# Altium schematic sheet Top_Section.SchDoc
size 420 x 297 mm; SheetNumber: 1; SheetTotal: 5
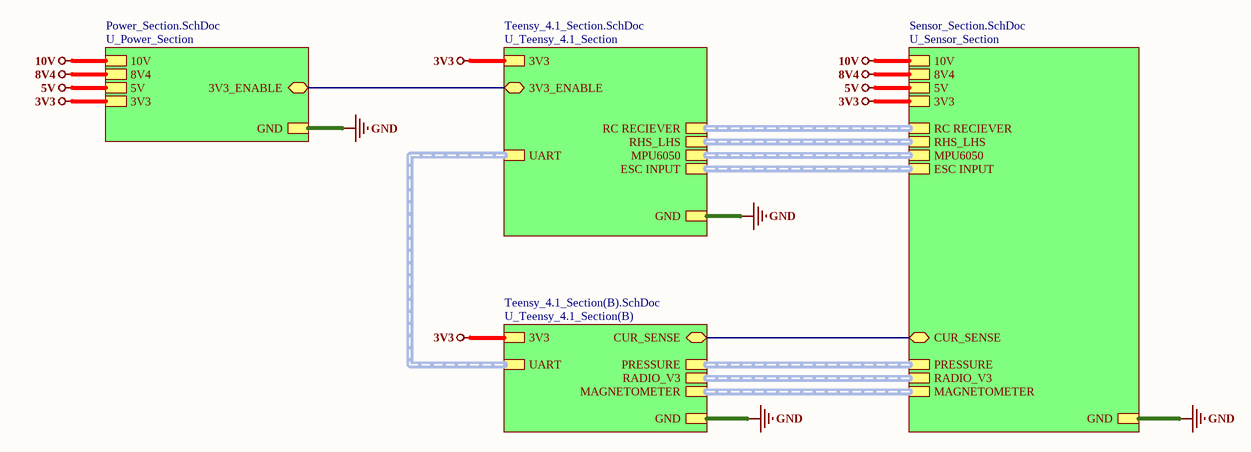
[diagram p0: Top_Section.SchDoc]

## Sub-sheets
U_Power_Section = Power_Section.SchDoc: 8V4, GND, 10V, 5V, 3V3, 3V3_ENABLE (bidir)
U_Sensor_Section = Sensor_Section.SchDoc: RC RECIEVER (harness RC _RECIEVER), RHS_LHS (harness RHS_LHS), PRESSURE (harness PRESSURE), RADIO_V3 (harness RADIO_V3), MAGNETOMETER (harness MAGNETOMETER), MPU6050 (harness MPU6050), ESC INPUT (harness ESC INPUT), CUR_SENSE (bidir), 8V4, GND, 10V, 5V, 3V3
U_Teensy_4.1_Section = Teensy_4.1_Section.SchDoc: GND, 3V3, 3V3_ENABLE (bidir), RC RECIEVER (harness RC _RECIEVER), RHS_LHS (harness RHS_LHS), MPU6050 (harness MPU6050), ESC INPUT (harness ESC INPUT), UART (harness UART)
U_Teensy_4.1_Section(B) = Teensy_4.1_Section(B).SchDoc: PRESSURE (harness PRESSURE), MAGNETOMETER (harness MAGNETOMETER), GND, 3V3, CUR_SENSE (bidir), UART (harness UART), RADIO_V3 (harness RADIO_V3)

## Nets
3V3: sheet U_Power_Section/3V3, sheet U_Sensor_Section/3V3, sheet U_Teensy_4.1_Section/3V3, sheet U_Teensy_4.1_Section(B)/3V3
5V: sheet U_Power_Section/5V, sheet U_Sensor_Section/5V
8V4: sheet U_Power_Section/8V4, sheet U_Sensor_Section/8V4
10V: sheet U_Power_Section/10V, sheet U_Sensor_Section/10V
GND: sheet U_Power_Section/GND, sheet U_Sensor_Section/GND, sheet U_Teensy_4.1_Section/GND, sheet U_Teensy_4.1_Section(B)/GND
(unnamed): sheet U_Power_Section/3V3_ENABLE, sheet U_Teensy_4.1_Section/3V3_ENABLE
(unnamed): sheet U_Sensor_Section/CUR_SENSE, sheet U_Teensy_4.1_Section(B)/CUR_SENSE

## Buses and harness runs
harness sheet U_Sensor_Section/ESC INPUT = sheet U_Teensy_4.1_Section/ESC INPUT
harness sheet U_Sensor_Section/MAGNETOMETER = sheet U_Teensy_4.1_Section(B)/MAGNETOMETER
harness sheet U_Sensor_Section/MPU6050 = sheet U_Teensy_4.1_Section/MPU6050
harness sheet U_Sensor_Section/PRESSURE = sheet U_Teensy_4.1_Section(B)/PRESSURE
harness sheet U_Sensor_Section/RADIO_V3 = sheet U_Teensy_4.1_Section(B)/RADIO_V3
harness sheet U_Sensor_Section/RC RECIEVER = sheet U_Teensy_4.1_Section/RC RECIEVER
harness sheet U_Sensor_Section/RHS_LHS = sheet U_Teensy_4.1_Section/RHS_LHS
harness sheet U_Teensy_4.1_Section(B)/UART = sheet U_Teensy_4.1_Section/UART

## Notes on the sheet
- File:
- Title:
- Date:
- Page
- Num:
- Total:
- Drawn By: Huzaifa Ali